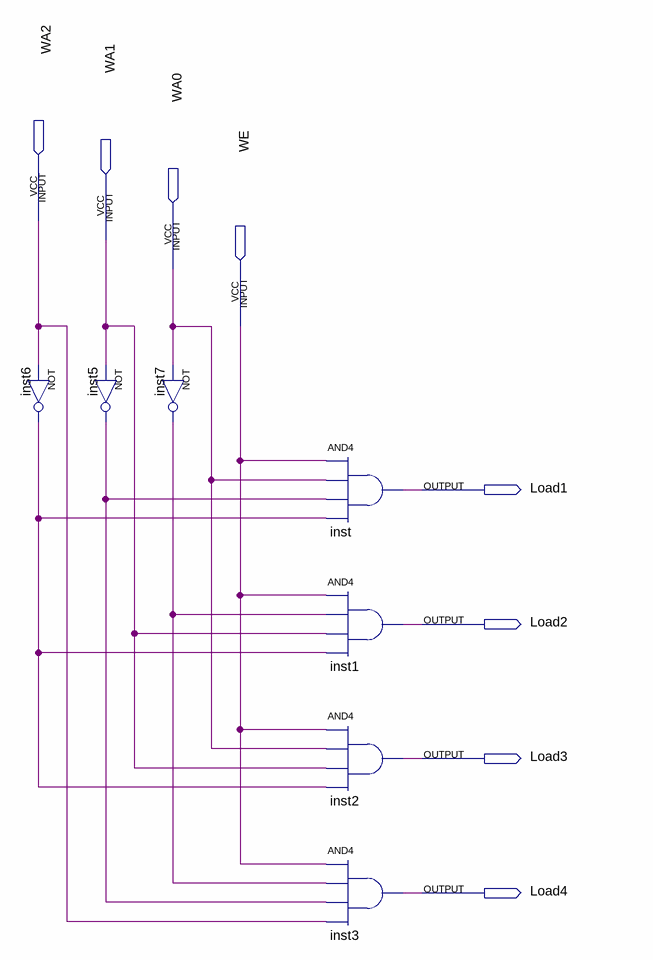
[diagram p0: schematic sheet]
// Quartus schematic Load_WA.bdf as structural Verilog: 7 symbols, 8 pins
module Load_WA (
  input  WA2,
  input  WA1,
  input  WA0,
  input  WE,
  output Load1,
  output Load2,
  output Load3,
  output Load4
);

  wire inst5_out, inst6_out, inst7_out;

  not inst6 (inst6_out, WA2);
  not inst5 (inst5_out, WA1);
  not inst7 (inst7_out, WA0);
  and inst (Load1, WE, WA0, inst5_out, inst6_out);
  and inst1 (Load2, WE, inst7_out, WA1, inst6_out);
  and inst2 (Load3, WE, WA0, WA1, inst6_out);
  and inst3 (Load4, WE, inst7_out, inst5_out, WA2);
endmodule
